# Altium schematic sheet Sheet2.SchDoc
size A4; SheetNumber: 1; SheetTotal: 1
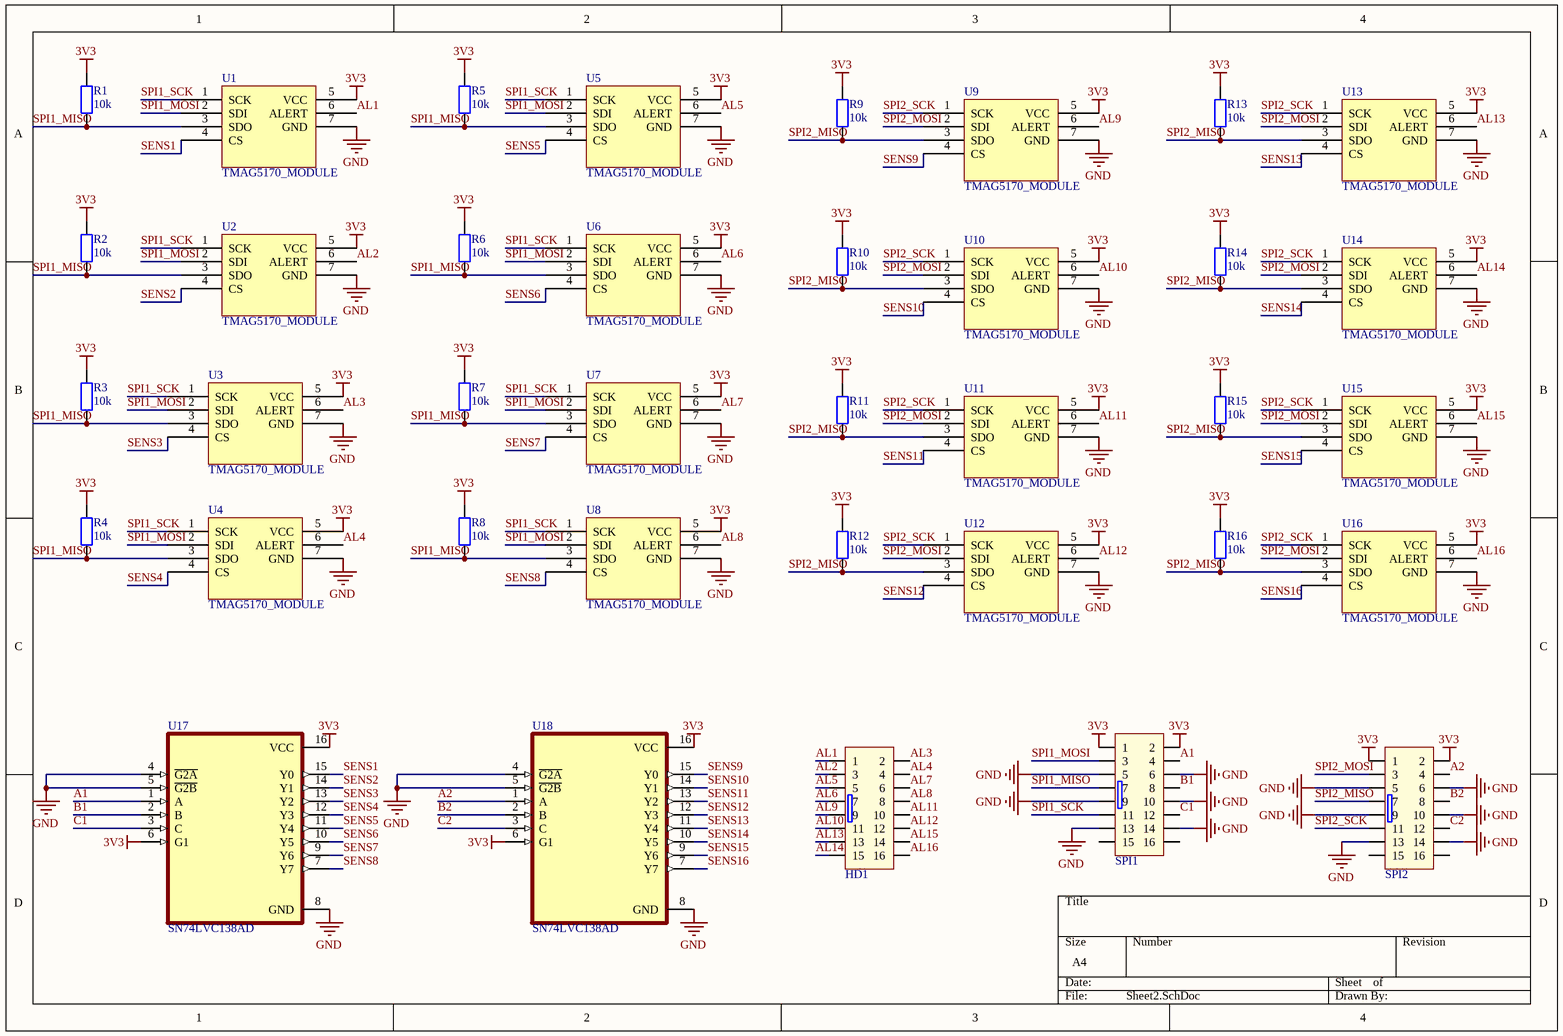
[diagram p0: Sheet2.SchDoc]

## Parts
HD1  IDC 8X2  [IDC16]  (value not drawn)
R1  10k  [RES-SMD-0805]
R2  10k  [RES-SMD-0805]
R3  10k  [RES-SMD-0805]
R4  10k  [RES-SMD-0805]
R5  10k  [RES-SMD-0805]
R6  10k  [RES-SMD-0805]
R7  10k  [RES-SMD-0805]
R8  10k  [RES-SMD-0805]
R9  10k  [RES-SMD-0805]
R10  10k  [RES-SMD-0805]
R11  10k  [RES-SMD-0805]
R12  10k  [RES-SMD-0805]
R13  10k  [RES-SMD-0805]
R14  10k  [RES-SMD-0805]
R15  10k  [RES-SMD-0805]
R16  10k  [RES-SMD-0805]
SPI1  IDC 8X2  [IDC16]  (value not drawn)
SPI2  IDC 8X2  [IDC16]  (value not drawn)
U1  TMAG5170_MODULE  [PCBComponent_1 - duplicate]
U2  TMAG5170_MODULE  [PCBComponent_1 - duplicate]
U3  TMAG5170_MODULE  [PCBComponent_1 - duplicate]
U4  TMAG5170_MODULE  [PCBComponent_1 - duplicate]
U5  TMAG5170_MODULE  [PCBComponent_1 - duplicate]
U6  TMAG5170_MODULE  [PCBComponent_1 - duplicate]
U7  TMAG5170_MODULE  [PCBComponent_1 - duplicate]
U8  TMAG5170_MODULE  [PCBComponent_1 - duplicate]
U9  TMAG5170_MODULE  [PCBComponent_1 - duplicate]
U10  TMAG5170_MODULE  [PCBComponent_1 - duplicate]
U11  TMAG5170_MODULE  [PCBComponent_1 - duplicate]
U12  TMAG5170_MODULE  [PCBComponent_1 - duplicate]
U13  TMAG5170_MODULE  [PCBComponent_1 - duplicate]
U14  TMAG5170_MODULE  [PCBComponent_1 - duplicate]
U15  TMAG5170_MODULE  [PCBComponent_1 - duplicate]
U16  TMAG5170_MODULE  [PCBComponent_1 - duplicate]
U17  SN74LVC138AD  [SOIC127P600X175-16N]
U18  SN74LVC138AD  [SOIC127P600X175-16N]

## Nets
3V3: R1.1 R2.1 R3.1 R4.1 R5.1 R6.1 R7.1 R8.1 R9.1 R10.1 R11.1 R12.1 R13.1 R14.1 R15.1 R16.1 SPI1.1 SPI1.2 SPI2.1 SPI2.2 U1.5(VCC) U2.5(VCC) U3.5(VCC) U4.5(VCC) U5.5(VCC) U6.5(VCC) U7.5(VCC) U8.5(VCC) U9.5(VCC) U10.5(VCC) U11.5(VCC) U12.5(VCC) U13.5(VCC) U14.5(VCC) U15.5(VCC) U16.5(VCC) U17.6(G1) U17.16(VCC) U18.6(G1) U18.16(VCC)
GND: SPI1.5 SPI1.6 SPI1.9 SPI1.10 SPI1.13 SPI1.14 SPI2.5 SPI2.6 SPI2.9 SPI2.10 SPI2.13 SPI2.14 U1.7(GND) U2.7(GND) U3.7(GND) U4.7(GND) U5.7(GND) U6.7(GND) U7.7(GND) U8.7(GND) U9.7(GND) U10.7(GND) U11.7(GND) U12.7(GND) U13.7(GND) U14.7(GND) U15.7(GND) U16.7(GND) U17.4(~{G2A}) U17.5(~{G2B}) U17.8(GND) U18.4(~{G2A}) U18.5(~{G2B}) U18.8(GND)
A1: SPI1.4 U17.1(A)
A2: SPI2.4 U18.1(A)
AL1: HD1.1 U1.6(ALERT)
AL2: HD1.3 U2.6(ALERT)
AL3: HD1.2 U3.6(ALERT)
AL4: HD1.4 U4.6(ALERT)
AL5: HD1.5 U5.6(ALERT)
AL6: HD1.7 U6.6(ALERT)
AL7: HD1.6 U7.6(ALERT)
AL8: HD1.8 U8.6(ALERT)
AL9: HD1.9 U9.6(ALERT)
AL10: HD1.11 U10.6(ALERT)
AL11: HD1.10 U11.6(ALERT)
AL12: HD1.12 U12.6(ALERT)
AL13: HD1.13 U13.6(ALERT)
AL14: HD1.15 U14.6(ALERT)
AL15: HD1.14 U15.6(ALERT)
AL16: HD1.16 U16.6(ALERT)
B1: SPI1.8 U17.2(B)
B2: SPI2.8 U18.2(B)
C1: SPI1.12 U17.3(C)
C2: SPI2.12 U18.3(C)
SENS1: U1.4(CS) U17.15(Y0)
SENS2: U2.4(CS) U17.14(Y1)
SENS3: U3.4(CS) U17.13(Y2)
SENS4: U4.4(CS) U17.12(Y3)
SENS5: U5.4(CS) U17.11(Y4)
SENS6: U6.4(CS) U17.10(Y5)
SENS7: U7.4(CS) U17.9(Y6)
SENS8: U8.4(CS) U17.7(Y7)
SENS9: U9.4(CS) U18.15(Y0)
SENS10: U10.4(CS) U18.14(Y1)
SENS11: U11.4(CS) U18.13(Y2)
SENS12: U12.4(CS) U18.12(Y3)
SENS13: U13.4(CS) U18.11(Y4)
SENS14: U14.4(CS) U18.10(Y5)
SENS15: U15.4(CS) U18.9(Y6)
SENS16: U16.4(CS) U18.7(Y7)
SPI1_MISO: R1.2 R2.2 R3.2 R4.2 R5.2 R6.2 R7.2 R8.2 SPI1.7 U1.3(SDO) U2.3(SDO) U3.3(SDO) U4.3(SDO) U5.3(SDO) U6.3(SDO) U7.3(SDO) U8.3(SDO)
SPI1_MOSI: SPI1.3 U1.2(SDI) U2.2(SDI) U3.2(SDI) U4.2(SDI) U5.2(SDI) U6.2(SDI) U7.2(SDI) U8.2(SDI)
SPI1_SCK: SPI1.11 U1.1(SCK) U2.1(SCK) U3.1(SCK) U4.1(SCK) U5.1(SCK) U6.1(SCK) U7.1(SCK) U8.1(SCK)
SPI2_MISO: R9.2 R10.2 R11.2 R12.2 R13.2 R14.2 R15.2 R16.2 SPI2.7 U9.3(SDO) U10.3(SDO) U11.3(SDO) U12.3(SDO) U13.3(SDO) U14.3(SDO) U15.3(SDO) U16.3(SDO)
SPI2_MOSI: SPI2.3 U9.2(SDI) U10.2(SDI) U11.2(SDI) U12.2(SDI) U13.2(SDI) U14.2(SDI) U15.2(SDI) U16.2(SDI)
SPI2_SCK: SPI2.11 U9.1(SCK) U10.1(SCK) U11.1(SCK) U12.1(SCK) U13.1(SCK) U14.1(SCK) U15.1(SCK) U16.1(SCK)

Not connected (* = marked no-connect by the designer): SPI1 15 16; SPI2 15 16

## Library data of the parts
HD1 SPI1 SPI2 = IDC 8x2: Value: Header 5x2
R1-R16 = Resistor - SMD: Resistor SMD; Manufacturer: Generic Components; Class: Passive; Published: 08/06/2000; Publisher: Altium Hobart Technology Centre
U1-U16 = TMAG5170_MODULE: Module TMAG5170 Hall sensor
U17 U18 = SN74LVC138AD: 3-Line To 8-Line decoder/Demultiplexer; MF: Texas Instruments; SnapEDA_Link: https://www.snapeda.com/parts/SN74LVC138AD/Texas+Instruments/view-part/?ref=snap; Package: SOIC-16 Texas Instruments; Value: *; MP: SN74LVC138AD; Check_prices: https://www.snapeda.com/parts/SN74LVC138AD/Texas+Instruments/view-part/?ref=eda